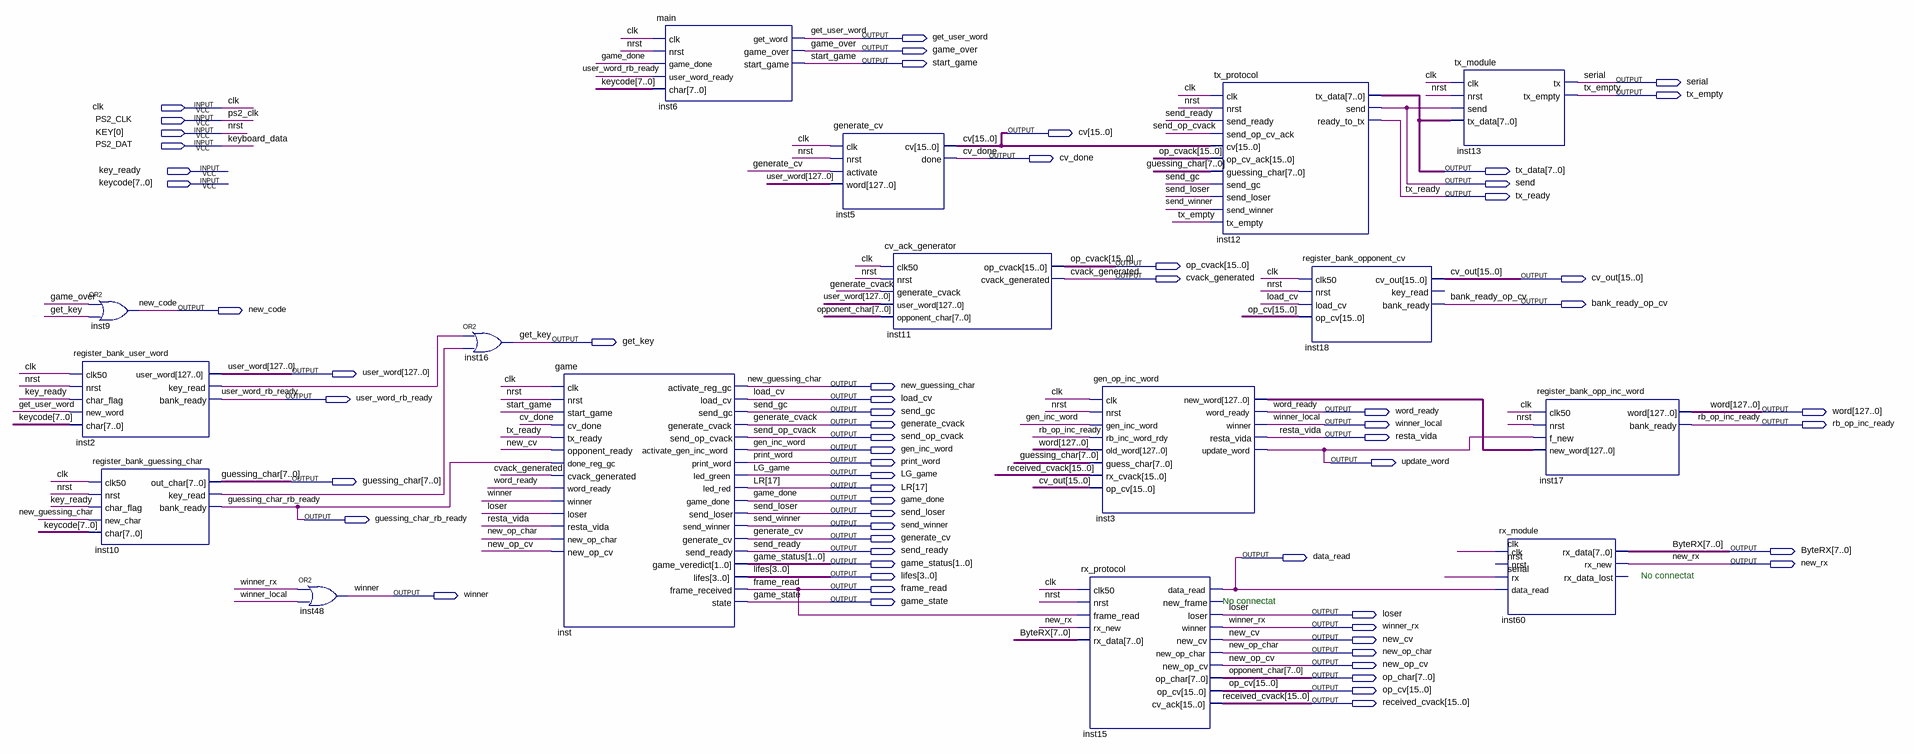
[diagram p0: schematic sheet]
// Quartus schematic hangman_sim.bdf as structural Verilog: 16 symbols, 62 pins
module hangman_sim (
  input  clk,
  input  PS2_CLK,
  input  [0:0] KEY,
  input  PS2_DAT,
  input  key_ready,
  input  [7:0] keycode,
  output get_user_word,
  output game_over,
  output start_game,
  output serial,
  output tx_empty,
  output [15:0] cv,
  output cv_done,
  output [7:0] tx_data,
  output send,
  output tx_ready,
  output [15:0] op_cvack,
  output cvack_generated,
  output [15:0] cv_out,
  output bank_ready_op_cv,
  output new_code,
  output get_key,
  output [127:0] user_word,
  output new_guessing_char,
  output user_word_rb_ready,
  output load_cv,
  output send_gc,
  output word_ready,
  output [127:0] word,
  output generate_cvack,
  output winner_local,
  output rb_op_inc_ready,
  output send_op_cvack,
  output resta_vida,
  output gen_inc_word,
  output print_word,
  output update_word,
  output LG_game,
  output [7:0] guessing_char,
  output [17:17] LR,
  output game_done,
  output send_loser,
  output guessing_char_rb_ready,
  output send_winner,
  output generate_cv,
  output send_ready,
  output [7:0] ByteRX,
  output data_read,
  output [1:0] game_status,
  output new_rx,
  output [3:0] lifes,
  output frame_read,
  output winner,
  output game_state,
  output loser,
  output winner_rx,
  output new_cv,
  output new_op_char,
  output new_op_cv,
  output [7:0] op_char,
  output [15:0] op_cv,
  output [15:0] received_cvack
);

  wire inst2_key_read, inst10_key_read;
  wire [127:0] inst3_new_word;

  or inst9 (new_code, game_over, get_key);
  register_bank_user_word inst2 (
    .clk50(clk), .nrst(KEY[0]), .char_flag(key_ready), .new_word(get_user_word), .char(keycode),
    .user_word(user_word), .key_read(inst2_key_read), .bank_ready(user_word_rb_ready));
  register_bank_guessing_char inst10 (
    .clk50(clk), .nrst(KEY[0]), .char_flag(key_ready), .new_char(new_guessing_char), .char(keycode),
    .out_char(guessing_char), .key_read(inst10_key_read), .bank_ready(guessing_char_rb_ready));
  or inst48 (winner, winner_rx, winner_local);
  or inst16 (get_key, inst2_key_read, inst10_key_read);
  game inst (
    .clk(clk), .nrst(KEY[0]), .start_game(start_game), .cv_done(cv_done), .tx_ready(tx_ready),
    .opponent_ready(new_cv), .done_reg_gc(guessing_char_rb_ready), .cvack_generated(cvack_generated),
    .word_ready(word_ready), .winner(winner), .loser(loser), .resta_vida(resta_vida),
    .new_op_char(new_op_char), .new_op_cv(new_op_cv), .activate_reg_gc(new_guessing_char), .load_cv(load_cv),
    .send_gc(send_gc), .generate_cvack(generate_cvack), .send_op_cvack(send_op_cvack),
    .activate_gen_inc_word(gen_inc_word), .print_word(print_word), .led_green(LG_game), .led_red(LR[17]),
    .game_done(game_done), .send_loser(send_loser), .send_winner(send_winner), .generate_cv(generate_cv),
    .send_ready(send_ready), .game_veredict(game_status), .lifes(lifes), .frame_received(frame_read),
    .state(game_state));
  main inst6 (
    .clk(clk), .nrst(KEY[0]), .game_done(game_done), .user_word_ready(user_word_rb_ready), .char(keycode),
    .get_word(get_user_word), .game_over(game_over), .start_game(start_game));
  generate_cv inst5 (.clk(clk), .nrst(KEY[0]), .activate(generate_cv), .word(user_word), .cv(cv), .done(cv_done));
  cv_ack_generator inst11 (
    .clk50(clk), .nrst(KEY[0]), .generate_cvack(generate_cvack), .user_word(user_word),
    .opponent_char(op_char), .op_cvack(op_cvack), .cvack_generated(cvack_generated));
  gen_op_inc_word inst3 (
    .clk(clk), .nrst(KEY[0]), .gen_inc_word(gen_inc_word), .rb_inc_word_rdy(rb_op_inc_ready),
    .old_word(word), .guess_char(guessing_char), .rx_cvack(received_cvack), .op_cv(cv_out),
    .new_word(inst3_new_word), .word_ready(word_ready), .winner(winner_local), .resta_vida(resta_vida),
    .update_word(update_word));
  rx_protocol inst15 (
    .clk50(clk), .nrst(KEY[0]), .frame_read(frame_read), .rx_new(new_rx), .rx_data(ByteRX),
    .data_read(data_read), .loser(loser), .winner(winner_rx), .new_cv(new_cv), .new_op_char(new_op_char),
    .new_op_cv(new_op_cv), .op_char(op_char), .op_cv(op_cv), .cv_ack(received_cvack));  // open: new_frame
  tx_protocol inst12 (
    .clk(clk), .nrst(KEY[0]), .send_ready(send_ready), .send_op_cv_ack(send_op_cvack), .cv(cv),
    .op_cv_ack(op_cvack), .guessing_char(guessing_char), .send_gc(send_gc), .send_loser(send_loser),
    .send_winner(send_winner), .tx_empty(tx_empty), .tx_data(tx_data), .send(send), .ready_to_tx(tx_ready));
  register_bank_opponent_cv inst18 (
    .clk50(clk), .nrst(KEY[0]), .load_cv(load_cv), .op_cv(op_cv), .cv_out(cv_out),
    .bank_ready(bank_ready_op_cv));  // open: key_read
  tx_module inst13 (.clk(clk), .nrst(KEY[0]), .send(send), .tx_data(tx_data), .tx(serial), .tx_empty(tx_empty));
  rx_module inst60 (
    .clk(clk), .nrst(KEY[0]), .rx(serial), .data_read(data_read), .rx_data(ByteRX), .rx_new(new_rx));  // open: rx_data_lost
  register_bank_opp_inc_word inst17 (
    .clk50(clk), .nrst(KEY[0]), .f_new(update_word), .new_word(inst3_new_word), .word(word),
    .bank_ready(rb_op_inc_ready));

  // Other names for the same wires on the sheet: keyboard_data = PS2_DAT; nrst = KEY[0]; opponent_char[7:0] = op_char

  // Notes on the sheet:
  //   No connectat
  //   No connectat
endmodule
